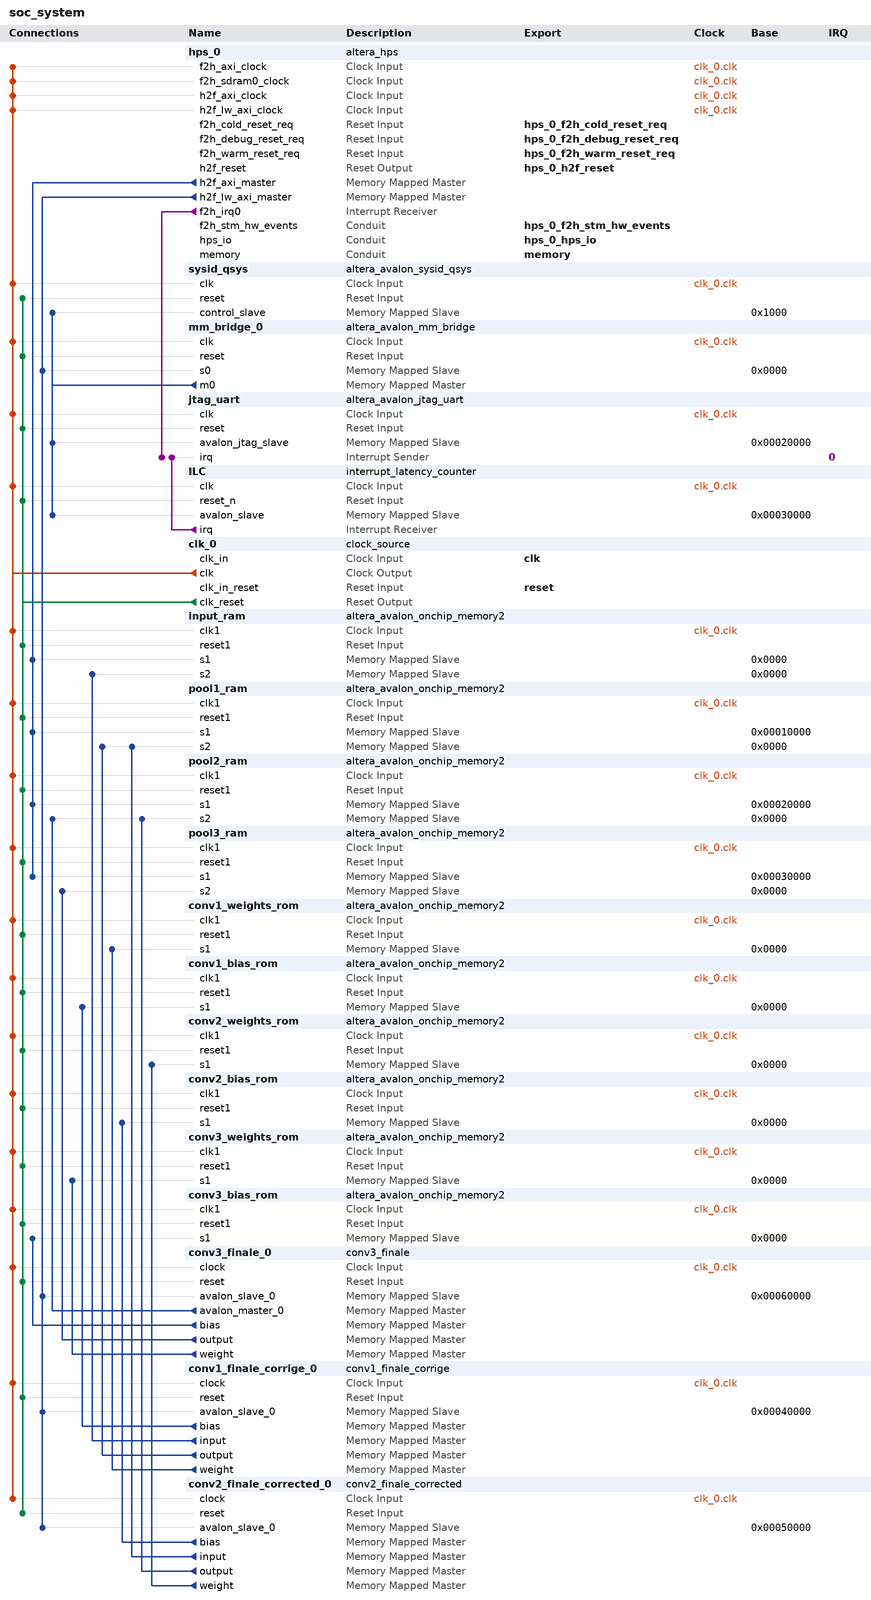
[diagram p0: system contents]
# Platform Designer (Qsys) system soc_system, Cyclone V 5CSXFC6D6F31C6
# Parameters at their usual value, and those the tool derives, are not listed.
package require -exact qsys 18.1
create_system soc_system
set_project_property DEVICE_FAMILY {Cyclone V}
set_project_property DEVICE 5CSXFC6D6F31C6

add_instance hps_0 altera_hps 18.1
set_instance_parameter_value hps_0 EMAC1_Mode RGMII
set_instance_parameter_value hps_0 EMAC1_PinMuxing {HPS I/O Set 0}
set_instance_parameter_value hps_0 F2SCLK_COLDRST_Enable true
set_instance_parameter_value hps_0 F2SCLK_DBGRST_Enable true
set_instance_parameter_value hps_0 F2SCLK_WARMRST_Enable true
set_instance_parameter_value hps_0 F2SDRAM_Type {Avalon-MM Bidirectional}
set_instance_parameter_value hps_0 F2SDRAM_Width 256
set_instance_parameter_value hps_0 F2SINTERRUPT_Enable true
set_instance_parameter_value hps_0 F2S_Width 2
set_instance_parameter_value hps_0 FPGA_PERIPHERAL_OUTPUT_CLOCK_FREQ_EMAC0_GTX_CLK 100
set_instance_parameter_value hps_0 FPGA_PERIPHERAL_OUTPUT_CLOCK_FREQ_EMAC0_MD_CLK 100.0
set_instance_parameter_value hps_0 FPGA_PERIPHERAL_OUTPUT_CLOCK_FREQ_EMAC1_GTX_CLK 100
set_instance_parameter_value hps_0 FPGA_PERIPHERAL_OUTPUT_CLOCK_FREQ_EMAC1_MD_CLK 100.0
set_instance_parameter_value hps_0 HPS_PROTOCOL DDR3
set_instance_parameter_value hps_0 I2C0_Mode I2C
set_instance_parameter_value hps_0 I2C0_PinMuxing {HPS I/O Set 0}
set_instance_parameter_value hps_0 I2C1_Mode I2C
set_instance_parameter_value hps_0 I2C1_PinMuxing {HPS I/O Set 0}
set_instance_parameter_value hps_0 LWH2F_Enable true
set_instance_parameter_value hps_0 MEM_BANKADDR_WIDTH 3
set_instance_parameter_value hps_0 MEM_CLK_FREQ 400.0
set_instance_parameter_value hps_0 MEM_COL_ADDR_WIDTH 10
set_instance_parameter_value hps_0 MEM_DQ_WIDTH 32
set_instance_parameter_value hps_0 MEM_DRV_STR RZQ/6
set_instance_parameter_value hps_0 MEM_ROW_ADDR_WIDTH 15
set_instance_parameter_value hps_0 MEM_RTT_NOM RZQ/6
set_instance_parameter_value hps_0 MEM_RTT_WR {Dynamic ODT off}
set_instance_parameter_value hps_0 MEM_TCL 11
set_instance_parameter_value hps_0 MEM_TFAW_NS 45.0
set_instance_parameter_value hps_0 MEM_TRAS_NS 35.0
set_instance_parameter_value hps_0 MEM_TRCD_NS 13.75
set_instance_parameter_value hps_0 MEM_TRFC_NS 260.0
set_instance_parameter_value hps_0 MEM_TRP_NS 13.75
set_instance_parameter_value hps_0 MEM_VENDOR Micron
set_instance_parameter_value hps_0 MEM_WTCL 7
set_instance_parameter_value hps_0 QSPI_Mode {1 SS}
set_instance_parameter_value hps_0 QSPI_PinMuxing {HPS I/O Set 0}
set_instance_parameter_value hps_0 REF_CLK_FREQ 25.0
set_instance_parameter_value hps_0 S2FCLK_USER2CLK 5
set_instance_parameter_value hps_0 S2F_Width 2
set_instance_parameter_value hps_0 SDIO_Mode {4-bit Data}
set_instance_parameter_value hps_0 SDIO_PinMuxing {HPS I/O Set 0}
set_instance_parameter_value hps_0 SPIM0_Mode {Single Slave Select}
set_instance_parameter_value hps_0 SPIM0_PinMuxing {HPS I/O Set 0}
set_instance_parameter_value hps_0 SPIM1_Mode {Single Slave Select}
set_instance_parameter_value hps_0 SPIM1_PinMuxing {HPS I/O Set 0}
set_instance_parameter_value hps_0 STM_Enable true
set_instance_parameter_value hps_0 TIMING_BOARD_AC_SKEW 0.02
set_instance_parameter_value hps_0 TIMING_BOARD_AC_TO_CK_SKEW 0.01
set_instance_parameter_value hps_0 TIMING_BOARD_DQ_TO_DQS_SKEW 0.05
set_instance_parameter_value hps_0 TIMING_BOARD_MAX_CK_DELAY 0.03
set_instance_parameter_value hps_0 TIMING_BOARD_MAX_DQS_DELAY 0.02
set_instance_parameter_value hps_0 TIMING_BOARD_SKEW_BETWEEN_DQS 0.06
set_instance_parameter_value hps_0 TIMING_BOARD_SKEW_CKDQS_DIMM_MAX 0.12
set_instance_parameter_value hps_0 TIMING_BOARD_SKEW_CKDQS_DIMM_MIN 0.06
set_instance_parameter_value hps_0 TIMING_BOARD_SKEW_WITHIN_DQS 0.01
set_instance_parameter_value hps_0 TIMING_TDH 65
set_instance_parameter_value hps_0 TIMING_TDQSCK 255
set_instance_parameter_value hps_0 TIMING_TDQSQ 125
set_instance_parameter_value hps_0 TIMING_TDS 30
set_instance_parameter_value hps_0 TIMING_TIH 140
set_instance_parameter_value hps_0 TIMING_TIS 190
set_instance_parameter_value hps_0 TIMING_TQSH 0.4
set_instance_parameter_value hps_0 UART0_Mode {No Flow Control}
set_instance_parameter_value hps_0 UART0_PinMuxing {HPS I/O Set 0}
set_instance_parameter_value hps_0 USB1_Mode SDR
set_instance_parameter_value hps_0 USB1_PinMuxing {HPS I/O Set 0}
set_instance_parameter_value hps_0 desired_cfg_clk_mhz 100.0
set_instance_parameter_value hps_0 desired_qspi_clk_mhz 400.0

add_instance sysid_qsys altera_avalon_sysid_qsys 18.1
set_instance_parameter_value sysid_qsys id -1395322110

add_instance mm_bridge_0 altera_avalon_mm_bridge 18.1
set_instance_parameter_value mm_bridge_0 ADDRESS_UNITS SYMBOLS
set_instance_parameter_value mm_bridge_0 ADDRESS_WIDTH 10
set_instance_parameter_value mm_bridge_0 DATA_WIDTH 32
set_instance_parameter_value mm_bridge_0 MAX_PENDING_RESPONSES 4
set_instance_parameter_value mm_bridge_0 USE_AUTO_ADDRESS_WIDTH 1

add_instance jtag_uart altera_avalon_jtag_uart 18.1
set_instance_parameter_value jtag_uart allowMultipleConnections true
set_instance_parameter_value jtag_uart simInteractiveOptions INTERACTIVE_ASCII_OUTPUT

add_instance ILC interrupt_latency_counter 18.1

add_instance clk_0 clock_source 18.1
set_instance_parameter_value clk_0 clockFrequency 50000000

add_instance input_ram altera_avalon_onchip_memory2 18.1
set_instance_parameter_value input_ram dataWidth 32
set_instance_parameter_value input_ram dualPort true
set_instance_parameter_value input_ram initMemContent true
set_instance_parameter_value input_ram initializationFileName onchip_mem.hex
set_instance_parameter_value input_ram memorySize 49152
set_instance_parameter_value input_ram singleClockOperation true

add_instance pool1_ram altera_avalon_onchip_memory2 18.1
set_instance_parameter_value pool1_ram dataWidth 32
set_instance_parameter_value pool1_ram dualPort true
set_instance_parameter_value pool1_ram initMemContent true
set_instance_parameter_value pool1_ram initializationFileName onchip_mem.hex
set_instance_parameter_value pool1_ram memorySize 63504
set_instance_parameter_value pool1_ram singleClockOperation true

add_instance pool2_ram altera_avalon_onchip_memory2 18.1
set_instance_parameter_value pool2_ram dataWidth 32
set_instance_parameter_value pool2_ram dualPort true
set_instance_parameter_value pool2_ram initMemContent true
set_instance_parameter_value pool2_ram initializationFileName onchip_mem.hex
set_instance_parameter_value pool2_ram memorySize 28800
set_instance_parameter_value pool2_ram singleClockOperation true

add_instance pool3_ram altera_avalon_onchip_memory2 18.1
set_instance_parameter_value pool3_ram dataWidth 32
set_instance_parameter_value pool3_ram dualPort true
set_instance_parameter_value pool3_ram initMemContent true
set_instance_parameter_value pool3_ram initializationFileName onchip_mem.hex
set_instance_parameter_value pool3_ram memorySize 50176
set_instance_parameter_value pool3_ram singleClockOperation true

add_instance conv1_weights_rom altera_avalon_onchip_memory2 18.1
set_instance_parameter_value conv1_weights_rom dataWidth 64
set_instance_parameter_value conv1_weights_rom dualPort false
set_instance_parameter_value conv1_weights_rom initMemContent true
set_instance_parameter_value conv1_weights_rom initializationFileName ../mif/conv1_weights_64.mif
set_instance_parameter_value conv1_weights_rom memorySize 432
set_instance_parameter_value conv1_weights_rom useNonDefaultInitFile true
set_instance_parameter_value conv1_weights_rom writable false

add_instance conv1_bias_rom altera_avalon_onchip_memory2 18.1
set_instance_parameter_value conv1_bias_rom dataWidth 32
set_instance_parameter_value conv1_bias_rom dualPort false
set_instance_parameter_value conv1_bias_rom initMemContent true
set_instance_parameter_value conv1_bias_rom initializationFileName ../mif/conv1_bias_32.mif
set_instance_parameter_value conv1_bias_rom memorySize 64
set_instance_parameter_value conv1_bias_rom useNonDefaultInitFile true
set_instance_parameter_value conv1_bias_rom writable false

add_instance conv2_weights_rom altera_avalon_onchip_memory2 18.1
set_instance_parameter_value conv2_weights_rom dataWidth 64
set_instance_parameter_value conv2_weights_rom dualPort false
set_instance_parameter_value conv2_weights_rom initMemContent true
set_instance_parameter_value conv2_weights_rom initializationFileName ../mif/conv2_weights_64.mif
set_instance_parameter_value conv2_weights_rom memorySize 4608
set_instance_parameter_value conv2_weights_rom useNonDefaultInitFile true
set_instance_parameter_value conv2_weights_rom writable false

add_instance conv2_bias_rom altera_avalon_onchip_memory2 18.1
set_instance_parameter_value conv2_bias_rom dataWidth 32
set_instance_parameter_value conv2_bias_rom dualPort false
set_instance_parameter_value conv2_bias_rom initMemContent true
set_instance_parameter_value conv2_bias_rom initializationFileName ../mif/conv2_bias_32.mif
set_instance_parameter_value conv2_bias_rom memorySize 128
set_instance_parameter_value conv2_bias_rom useNonDefaultInitFile true
set_instance_parameter_value conv2_bias_rom writable false

add_instance conv3_weights_rom altera_avalon_onchip_memory2 18.1
set_instance_parameter_value conv3_weights_rom dataWidth 8
set_instance_parameter_value conv3_weights_rom dualPort false
set_instance_parameter_value conv3_weights_rom initMemContent true
set_instance_parameter_value conv3_weights_rom initializationFileName ../mif/conv3_weights_8.mif
set_instance_parameter_value conv3_weights_rom memorySize 18432
set_instance_parameter_value conv3_weights_rom useNonDefaultInitFile true
set_instance_parameter_value conv3_weights_rom writable false

add_instance conv3_bias_rom altera_avalon_onchip_memory2 18.1
set_instance_parameter_value conv3_bias_rom dataWidth 32
set_instance_parameter_value conv3_bias_rom dualPort false
set_instance_parameter_value conv3_bias_rom initMemContent true
set_instance_parameter_value conv3_bias_rom initializationFileName ../mif/conv3_bias_32.mif
set_instance_parameter_value conv3_bias_rom memorySize 256
set_instance_parameter_value conv3_bias_rom useNonDefaultInitFile true
set_instance_parameter_value conv3_bias_rom writable false

add_instance conv3_finale_0 conv3_finale 1.0

add_instance conv1_finale_corrige_0 conv1_finale_corrige 1.0

add_instance conv2_finale_corrected_0 conv2_finale_corrected 1.0

# connections
add_connection clk_0.clk conv1_bias_rom.clk1 clock
add_connection clk_0.clk conv1_finale_corrige_0.clock clock
add_connection clk_0.clk conv1_weights_rom.clk1 clock
add_connection clk_0.clk conv2_bias_rom.clk1 clock
add_connection clk_0.clk conv2_finale_corrected_0.clock clock
add_connection clk_0.clk conv2_weights_rom.clk1 clock
add_connection clk_0.clk conv3_bias_rom.clk1 clock
add_connection clk_0.clk conv3_finale_0.clock clock
add_connection clk_0.clk conv3_weights_rom.clk1 clock
add_connection clk_0.clk hps_0.f2h_axi_clock clock
add_connection clk_0.clk hps_0.f2h_sdram0_clock clock
add_connection clk_0.clk hps_0.h2f_axi_clock clock
add_connection clk_0.clk hps_0.h2f_lw_axi_clock clock
add_connection clk_0.clk ILC.clk clock
add_connection clk_0.clk input_ram.clk1 clock
add_connection clk_0.clk jtag_uart.clk clock
add_connection clk_0.clk mm_bridge_0.clk clock
add_connection clk_0.clk pool1_ram.clk1 clock
add_connection clk_0.clk pool2_ram.clk1 clock
add_connection clk_0.clk pool3_ram.clk1 clock
add_connection clk_0.clk sysid_qsys.clk clock
add_connection clk_0.clk_reset conv1_bias_rom.reset1 reset
add_connection clk_0.clk_reset conv1_finale_corrige_0.reset reset
add_connection clk_0.clk_reset conv1_weights_rom.reset1 reset
add_connection clk_0.clk_reset conv2_bias_rom.reset1 reset
add_connection clk_0.clk_reset conv2_finale_corrected_0.reset reset
add_connection clk_0.clk_reset conv2_weights_rom.reset1 reset
add_connection clk_0.clk_reset conv3_bias_rom.reset1 reset
add_connection clk_0.clk_reset conv3_finale_0.reset reset
add_connection clk_0.clk_reset conv3_weights_rom.reset1 reset
add_connection clk_0.clk_reset ILC.reset_n reset
add_connection clk_0.clk_reset input_ram.reset1 reset
add_connection clk_0.clk_reset jtag_uart.reset reset
add_connection clk_0.clk_reset mm_bridge_0.reset reset
add_connection clk_0.clk_reset pool1_ram.reset1 reset
add_connection clk_0.clk_reset pool2_ram.reset1 reset
add_connection clk_0.clk_reset pool3_ram.reset1 reset
add_connection clk_0.clk_reset sysid_qsys.reset reset
add_connection conv1_finale_corrige_0.bias conv1_bias_rom.s1 avalon
set_connection_parameter_value conv1_finale_corrige_0.bias/conv1_bias_rom.s1 baseAddress 0x0000
add_connection conv1_finale_corrige_0.input input_ram.s2 avalon
set_connection_parameter_value conv1_finale_corrige_0.input/input_ram.s2 baseAddress 0x0000
add_connection conv1_finale_corrige_0.output pool1_ram.s2 avalon
set_connection_parameter_value conv1_finale_corrige_0.output/pool1_ram.s2 baseAddress 0x0000
add_connection conv1_finale_corrige_0.weight conv1_weights_rom.s1 avalon
set_connection_parameter_value conv1_finale_corrige_0.weight/conv1_weights_rom.s1 baseAddress 0x0000
add_connection conv2_finale_corrected_0.bias conv2_bias_rom.s1 avalon
set_connection_parameter_value conv2_finale_corrected_0.bias/conv2_bias_rom.s1 baseAddress 0x0000
add_connection conv2_finale_corrected_0.input pool1_ram.s2 avalon
set_connection_parameter_value conv2_finale_corrected_0.input/pool1_ram.s2 baseAddress 0x0000
add_connection conv2_finale_corrected_0.output pool2_ram.s2 avalon
set_connection_parameter_value conv2_finale_corrected_0.output/pool2_ram.s2 baseAddress 0x0000
add_connection conv2_finale_corrected_0.weight conv2_weights_rom.s1 avalon
set_connection_parameter_value conv2_finale_corrected_0.weight/conv2_weights_rom.s1 baseAddress 0x0000
add_connection conv3_finale_0.avalon_master_0 pool2_ram.s2 avalon
set_connection_parameter_value conv3_finale_0.avalon_master_0/pool2_ram.s2 baseAddress 0x0000
add_connection conv3_finale_0.bias conv3_bias_rom.s1 avalon
set_connection_parameter_value conv3_finale_0.bias/conv3_bias_rom.s1 baseAddress 0x0000
add_connection conv3_finale_0.output pool3_ram.s2 avalon
set_connection_parameter_value conv3_finale_0.output/pool3_ram.s2 baseAddress 0x0000
add_connection conv3_finale_0.weight conv3_weights_rom.s1 avalon
set_connection_parameter_value conv3_finale_0.weight/conv3_weights_rom.s1 baseAddress 0x0000
add_connection hps_0.h2f_axi_master input_ram.s1 avalon
set_connection_parameter_value hps_0.h2f_axi_master/input_ram.s1 baseAddress 0x0000
add_connection hps_0.h2f_axi_master pool1_ram.s1 avalon
set_connection_parameter_value hps_0.h2f_axi_master/pool1_ram.s1 baseAddress 0x00010000
add_connection hps_0.h2f_axi_master pool2_ram.s1 avalon
set_connection_parameter_value hps_0.h2f_axi_master/pool2_ram.s1 baseAddress 0x00020000
add_connection hps_0.h2f_axi_master pool3_ram.s1 avalon
set_connection_parameter_value hps_0.h2f_axi_master/pool3_ram.s1 baseAddress 0x00030000
add_connection hps_0.h2f_lw_axi_master conv1_finale_corrige_0.avalon_slave_0 avalon
set_connection_parameter_value hps_0.h2f_lw_axi_master/conv1_finale_corrige_0.avalon_slave_0 baseAddress 0x00040000
add_connection hps_0.h2f_lw_axi_master conv2_finale_corrected_0.avalon_slave_0 avalon
set_connection_parameter_value hps_0.h2f_lw_axi_master/conv2_finale_corrected_0.avalon_slave_0 baseAddress 0x00050000
add_connection hps_0.h2f_lw_axi_master conv3_finale_0.avalon_slave_0 avalon
set_connection_parameter_value hps_0.h2f_lw_axi_master/conv3_finale_0.avalon_slave_0 baseAddress 0x00060000
add_connection hps_0.h2f_lw_axi_master mm_bridge_0.s0 avalon
set_connection_parameter_value hps_0.h2f_lw_axi_master/mm_bridge_0.s0 baseAddress 0x0000
add_connection mm_bridge_0.m0 ILC.avalon_slave avalon
set_connection_parameter_value mm_bridge_0.m0/ILC.avalon_slave baseAddress 0x00030000
add_connection mm_bridge_0.m0 jtag_uart.avalon_jtag_slave avalon
set_connection_parameter_value mm_bridge_0.m0/jtag_uart.avalon_jtag_slave baseAddress 0x00020000
add_connection mm_bridge_0.m0 sysid_qsys.control_slave avalon
set_connection_parameter_value mm_bridge_0.m0/sysid_qsys.control_slave baseAddress 0x1000
add_connection hps_0.f2h_irq0 jtag_uart.irq interrupt
set_connection_parameter_value hps_0.f2h_irq0/jtag_uart.irq irqNumber 2
add_connection ILC.irq jtag_uart.irq interrupt
set_connection_parameter_value ILC.irq/jtag_uart.irq irqNumber 0

# exported interfaces
add_interface clk clock sink
set_interface_property clk EXPORT_OF clk_0.clk_in
add_interface hps_0_f2h_cold_reset_req reset sink
set_interface_property hps_0_f2h_cold_reset_req EXPORT_OF hps_0.f2h_cold_reset_req
add_interface hps_0_f2h_debug_reset_req reset sink
set_interface_property hps_0_f2h_debug_reset_req EXPORT_OF hps_0.f2h_debug_reset_req
add_interface hps_0_f2h_stm_hw_events conduit end
set_interface_property hps_0_f2h_stm_hw_events EXPORT_OF hps_0.f2h_stm_hw_events
add_interface hps_0_f2h_warm_reset_req reset sink
set_interface_property hps_0_f2h_warm_reset_req EXPORT_OF hps_0.f2h_warm_reset_req
add_interface hps_0_h2f_reset reset source
set_interface_property hps_0_h2f_reset EXPORT_OF hps_0.h2f_reset
add_interface hps_0_hps_io conduit end
set_interface_property hps_0_hps_io EXPORT_OF hps_0.hps_io
add_interface memory conduit end
set_interface_property memory EXPORT_OF hps_0.memory
add_interface reset reset sink
set_interface_property reset EXPORT_OF clk_0.clk_in_reset

set_interconnect_requirement {$system} qsys_mm.clockCrossingAdapter HANDSHAKE
set_interconnect_requirement {$system} qsys_mm.maxAdditionalLatency 1

save_system soc_system.qsys
